# Altium schematic sheet FPGA_Bank34.SchDoc: =DocumentName
size A3; DocumentNumber: 1; Revision: 0; SheetNumber: 1; SheetTotal: 1
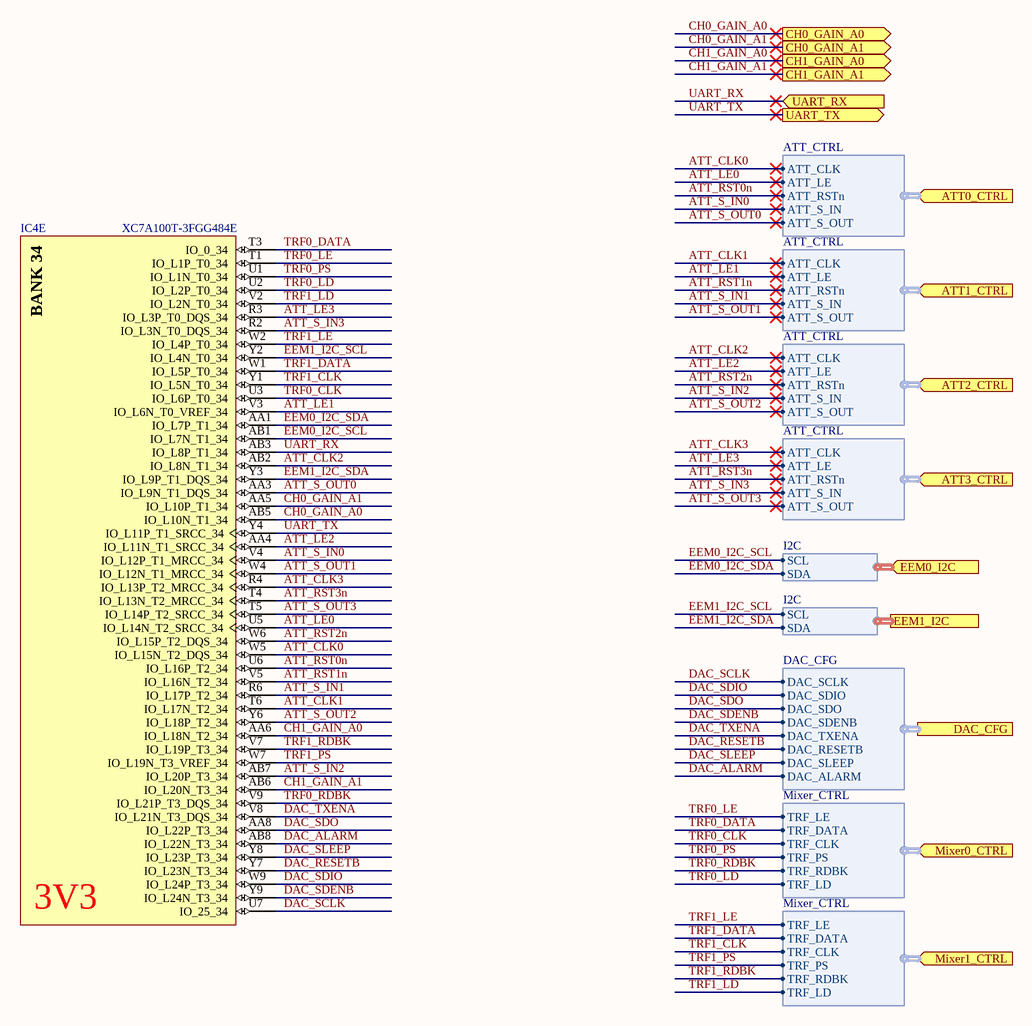
[diagram p0: FPGA_Bank34.SchDoc]

## Parts
IC4  XC7A100T-3FGG484E  [FGG484]  (part E of 10)

## Ports
ATT0_CTRL (in, harness ATT_CTRL), ATT1_CTRL (in, harness ATT_CTRL), ATT2_CTRL (in, harness ATT_CTRL), ATT3_CTRL (in, harness ATT_CTRL), CH0_GAIN_A0 (out), CH0_GAIN_A1 (out), CH1_GAIN_A0 (out), CH1_GAIN_A1 (out), DAC_CFG (harness DAC_CFG), EEM0_I2C (in, harness I2C), EEM1_I2C (harness I2C), Mixer0_CTRL (in, harness Mixer_CTRL), Mixer1_CTRL (in, harness Mixer_CTRL), UART_RX (in), UART_TX (out)

## Harnesses
I2C: SDA, SCL
DAC_CFG: DAC_SCLK, DAC_SDIO, DAC_SDO, DAC_SDENB, DAC_TXENA, DAC_RESETB, DAC_SLEEP, DAC_ALARM
Mixer_CTRL: TRF_LE, TRF_DATA, TRF_CLK, TRF_PS, TRF_RDBK, TRF_LD
ATT_CTRL: ATT_CLK, ATT_LE, ATT_RSTn, ATT_S_IN, ATT_S_OUT

## Nets
ATT_CLK0: IC4.W5(IO_L15N_T2_DQS_34) ; port ATT0_CTRL.ATT_CLK
ATT_CLK1: IC4.T6(IO_L17N_T2_34) ; port ATT1_CTRL.ATT_CLK
ATT_CLK2: IC4.AB2(IO_L8N_T1_34) ; port ATT2_CTRL.ATT_CLK
ATT_CLK3: IC4.R4(IO_L13P_T2_MRCC_34) ; port ATT3_CTRL.ATT_CLK
ATT_LE0: IC4.U5(IO_L14N_T2_SRCC_34) ; port ATT0_CTRL.ATT_LE
ATT_LE1: IC4.V3(IO_L6N_T0_VREF_34) ; port ATT1_CTRL.ATT_LE
ATT_LE2: IC4.AA4(IO_L11N_T1_SRCC_34) ; port ATT2_CTRL.ATT_LE
ATT_LE3: IC4.R3(IO_L3P_T0_DQS_34) ; port ATT3_CTRL.ATT_LE
ATT_RST0n: IC4.U6(IO_L16P_T2_34) ; port ATT0_CTRL.ATT_RSTn
ATT_RST1n: IC4.V5(IO_L16N_T2_34) ; port ATT1_CTRL.ATT_RSTn
ATT_RST2n: IC4.W6(IO_L15P_T2_DQS_34) ; port ATT2_CTRL.ATT_RSTn
ATT_RST3n: IC4.T4(IO_L13N_T2_MRCC_34) ; port ATT3_CTRL.ATT_RSTn
ATT_S_IN0: IC4.V4(IO_L12P_T1_MRCC_34) ; port ATT0_CTRL.ATT_S_IN
ATT_S_IN1: IC4.R6(IO_L17P_T2_34) ; port ATT1_CTRL.ATT_S_IN
ATT_S_IN2: IC4.AB7(IO_L20P_T3_34) ; port ATT2_CTRL.ATT_S_IN
ATT_S_IN3: IC4.R2(IO_L3N_T0_DQS_34) ; port ATT3_CTRL.ATT_S_IN
ATT_S_OUT0: IC4.AA3(IO_L9N_T1_DQS_34) ; port ATT0_CTRL.ATT_S_OUT
ATT_S_OUT1: IC4.W4(IO_L12N_T1_MRCC_34) ; port ATT1_CTRL.ATT_S_OUT
ATT_S_OUT2: IC4.Y6(IO_L18P_T2_34) ; port ATT2_CTRL.ATT_S_OUT
ATT_S_OUT3: IC4.T5(IO_L14P_T2_SRCC_34) ; port ATT3_CTRL.ATT_S_OUT
CH0_GAIN_A0: IC4.AB5(IO_L10N_T1_34) ; port CH0_GAIN_A0
CH0_GAIN_A1: IC4.AA5(IO_L10P_T1_34) ; port CH0_GAIN_A1
CH1_GAIN_A0: IC4.AA6(IO_L18N_T2_34) ; port CH1_GAIN_A0
CH1_GAIN_A1: IC4.AB6(IO_L20N_T3_34) ; port CH1_GAIN_A1
DAC_ALARM: IC4.AB8(IO_L22N_T3_34) ; port DAC_CFG.DAC_ALARM
DAC_RESETB: IC4.Y7(IO_L23N_T3_34) ; port DAC_CFG.DAC_RESETB
DAC_SCLK: IC4.U7(IO_25_34) ; port DAC_CFG.DAC_SCLK
DAC_SDENB: IC4.Y9(IO_L24N_T3_34) ; port DAC_CFG.DAC_SDENB
DAC_SDIO: IC4.W9(IO_L24P_T3_34) ; port DAC_CFG.DAC_SDIO
DAC_SDO: IC4.AA8(IO_L22P_T3_34) ; port DAC_CFG.DAC_SDO
DAC_SLEEP: IC4.Y8(IO_L23P_T3_34) ; port DAC_CFG.DAC_SLEEP
DAC_TXENA: IC4.V8(IO_L21N_T3_DQS_34) ; port DAC_CFG.DAC_TXENA
EEM0_I2C_SCL: IC4.AB1(IO_L7N_T1_34) ; port EEM0_I2C.SCL
EEM0_I2C_SDA: IC4.AA1(IO_L7P_T1_34) ; port EEM0_I2C.SDA
EEM1_I2C_SCL: IC4.Y2(IO_L4N_T0_34) ; port EEM1_I2C.SCL
EEM1_I2C_SDA: IC4.Y3(IO_L9P_T1_DQS_34) ; port EEM1_I2C.SDA
TRF0_CLK: IC4.U3(IO_L6P_T0_34) ; port Mixer0_CTRL.TRF_CLK
TRF0_DATA: IC4.T3(IO_0_34) ; port Mixer0_CTRL.TRF_DATA
TRF0_LD: IC4.U2(IO_L2P_T0_34) ; port Mixer0_CTRL.TRF_LD
TRF0_LE: IC4.T1(IO_L1P_T0_34) ; port Mixer0_CTRL.TRF_LE
TRF0_PS: IC4.U1(IO_L1N_T0_34) ; port Mixer0_CTRL.TRF_PS
TRF0_RDBK: IC4.V9(IO_L21P_T3_DQS_34) ; port Mixer0_CTRL.TRF_RDBK
TRF1_CLK: IC4.Y1(IO_L5N_T0_34) ; port Mixer1_CTRL.TRF_CLK
TRF1_DATA: IC4.W1(IO_L5P_T0_34) ; port Mixer1_CTRL.TRF_DATA
TRF1_LD: IC4.V2(IO_L2N_T0_34) ; port Mixer1_CTRL.TRF_LD
TRF1_LE: IC4.W2(IO_L4P_T0_34) ; port Mixer1_CTRL.TRF_LE
TRF1_PS: IC4.W7(IO_L19N_T3_VREF_34) ; port Mixer1_CTRL.TRF_PS
TRF1_RDBK: IC4.V7(IO_L19P_T3_34) ; port Mixer1_CTRL.TRF_RDBK
UART_RX: IC4.AB3(IO_L8P_T1_34) ; port UART_RX
UART_TX: IC4.Y4(IO_L11P_T1_SRCC_34) ; port UART_TX

## Notes on the sheet
- 3V3
- Release
- Last modified =ModifiedDate
  Sheet =sheetnumber of =sheettotal · Size A3
- Copyright =P_copyright_owner
  This source describes Open Hardware and is licensed under the CERN-OHL-W v2. You may redistribute and modify this source and make products using it under the terms of the CERN-OHL-W v2 (https://cern.ch/cern-ohl). This source is distributed WITHOUT ANY EXPRESS OR IMPLIED WARRANTY, INCLUDING OF MERCHANTABILITY, SATISFACTORY QUALITY AND FITNESS FOR A PARTICULAR PURPOSE. Please see the CERN-OHL-W v2 for applicable conditions.
  Notice: If You produce hardware based on this source, You must maintain the Source Location visible on the product, its packaging or its documentation.
- SINARA OPEN HARDWARE
- OPEN HARDWARE FOR SCIENTIFIC INSTRUMENTATION
- https://github.com/sinara-hw
- Release owner
- Designers
- Reviewers
- Source location:
- (in symbol CMP-0364-00028-3, part E) BANK 34

## Library data of the parts
IC4 = CMP-0364-00028-3: Artix-7 FPGA, 285 User I/Os, 4 GTP, 484-Ball BGA, Speed Grade 3, Extended Grade, Pb-Free; Manufacturer: Xilinx; Max User I/O: 300; Clock Mgmt Tiles (CMTs): 6; Logic Cells: 101440; Block RAM Blocks (36Kb): 135; Block RAM Blocks (18Kb): 270; Speed Grade: -3; CLBs (Slices): 15850; Block RAM Blocks (Max Kb): 4860; DSP48E1 Slices: 240; RoHS: Pb-Free; ComponentLink3URL: http://www.xilinx.com/support/documentation/data_sheets/ds181_Artix_7_Data_Sheet.pdf; NexusDeviceID: XC7A100T-3FGG484E; DatasheetVersion: v1.12; Mounting Technology: Surface Mount; PackageDescription: Wire-Bond Fine-Pitch BGA, Body 23 x 23 mm, 1.0 mm Pitch; PackageReference: FGG484; ComponentLink2Description: Package Specification; Code_JEDEC: MS-034-AAJ-1; ComponentLink2URL: http://www.xilinx.com/support/documentation/user_guides/ug475_7Series_Pkg_Pinout.pdf; ComponentLink3Description: DC and Switching Characteristics; Generic Part Number: XC7A100T; ComponentLink4Description: Package File; ComponentLink4URL: http://www.xilinx.com/support/packagefiles/a7packages/xc7a100tfgg484pkg.txt; ComponentLink1URL: http://www.xilinx.com/support/documentation/data_sheets/ds180_7Series_Overview.pdf; PartNumber: XC7A100T-3FGG484E; ComponentLink5URL: http://www.xilinx.com/support/documentation/user_guides/ug475_7Series_Pkg_Pinout.pdf; PackageVersion: Rev 1.8; ComponentLink5Description: Packaging and Pinout; ComponentLink1Description: Datasheet; CLBs (Max Distributed RAM Kb): 1188